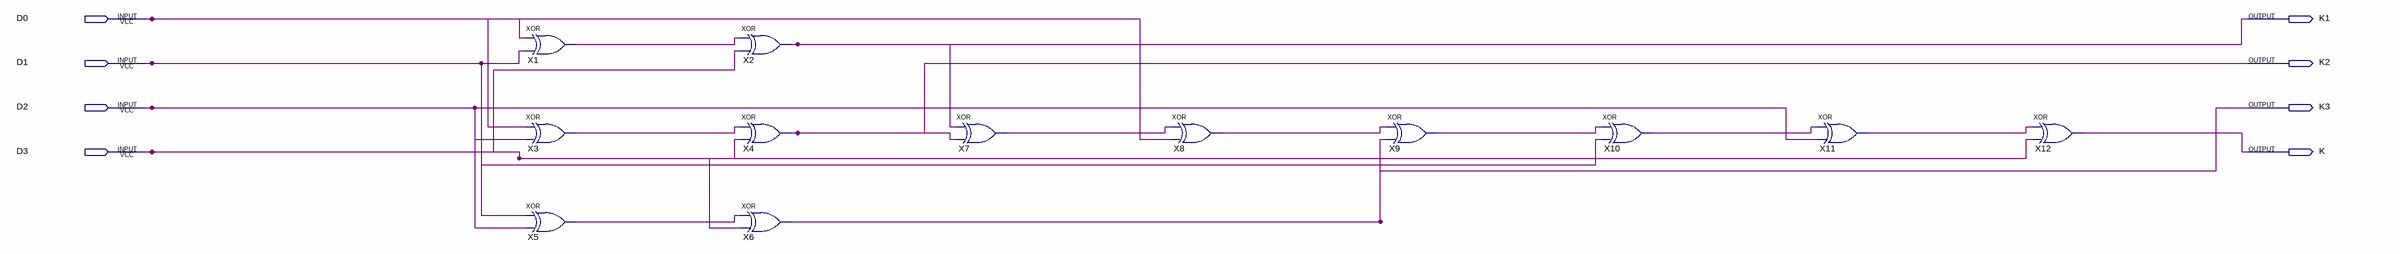
[diagram p0: schematic sheet]
// Quartus schematic encoder.bdf as structural Verilog: 12 symbols, 8 pins
module encoder (
  input  D0,
  input  D1,
  input  D2,
  input  D3,
  output K1,
  output K2,
  output K3,
  output K
);

  wire X1_out, X3_out, X5_out, X7_out, X8_out, X9_out, X10_out, X11_out;

  xor X1 (X1_out, D0, D1);
  xor X3 (X3_out, D0, D2);
  xor X5 (X5_out, D1, D2);
  xor X2 (K1, X1_out, D3);
  xor X4 (K2, X3_out, D3);
  xor X6 (K3, X5_out, D3);
  xor X7 (X7_out, K1, K2);
  xor X8 (X8_out, X7_out, D0);
  xor X9 (X9_out, X8_out, K3);
  xor X10 (X10_out, X9_out, D1);
  xor X11 (X11_out, X10_out, D2);
  xor X12 (K, X11_out, D3);
endmodule
